# Altium project LED-Board_v2.1.PrjPcb
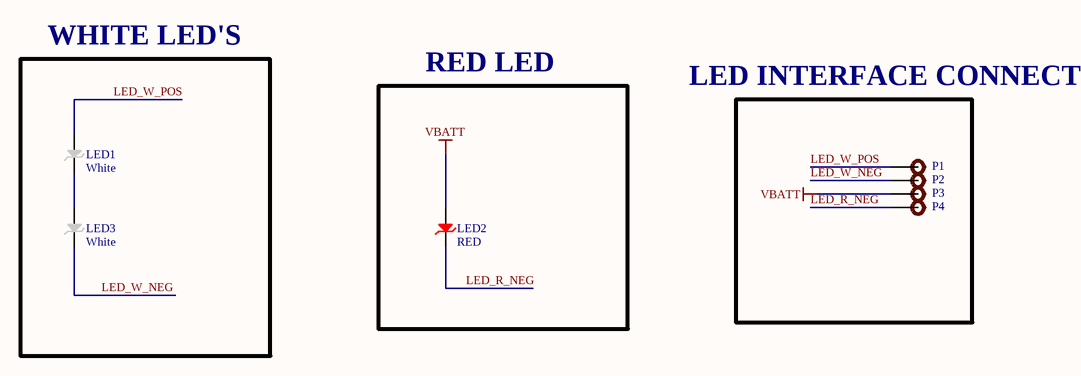
[diagram p0: LEDs_Sheet.SchDoc]
1 sheet, 7 parts. Net scope: global (net labels, ports and power ports of the same name join across sheets).
Board file: PCB_LED_Board_v2.1.PcbDoc

## Sheet LEDs_Sheet.SchDoc
size A; SheetNumber: 1; SheetTotal: 1

### Parts
LED1  White  [LED_SPHWH2L3D30CD4QTP3]
LED2  RED  [LED_SPHRD2L3DH20E7W41J]
LED3  White  [LED_SPHWH2L3D30CD4QTP3]
P1  TEST POINT  [Test-point]  (value not drawn)  (no BOM)
P2  TEST POINT  [Test-point]  (value not drawn)  (no BOM)
P3  TEST POINT  [Test-point]  (value not drawn)  (no BOM)
P4  TEST POINT  [Test-point]  (value not drawn)  (no BOM)

### Blocks framed on the sheet
WHITE LED'S: LED1 LED3
RED LED: LED2

### Nets
VBATT: LED2.1(A) P3.1
LED_R_NEG: LED2.2(K) P4.1
LED_W_NEG: LED3.2(K) P2.1
LED_W_POS: LED1.1(A) P1.1
NetLED1_2: LED1.2(K) LED3.1(A)

### Notes on the sheet
- LED INTERFACE CONNECTOR

### Library data of the parts
LED1 LED3 = SPHWH2L3D30CD4QTP3: LED Lighting LH351B White, Cool 5700K 2.8V 350mA 120° 1414 (3535 Metric); Manufacturer: Samsung Semiconductor, Inc.; Manufacturer Part Number: SPHWH2L3D30CD4QTP3; Digikey Part Number: 1510-2143-6-ND; Item Type: LED; Package: 0.138" L x 0.138" W (3.50mm x 3.50mm); ComponentLink1Description: Digikey Link; ComponentLink1URL: https://www.digikey.com/en/products/detail/samsung-semiconductor-inc/SPHWH2L3D30CD4QTP3/6569391
LED2 = SPHRD2L3DH20E7W41J: LED Lighting Color LH351H Red 660nm (650nm ~ 670nm); Manufacturer: Samsung Semiconductor, Inc.; Manufacturer Part Number: SPHRD2L3DH20E7W41J; Digikey Part Number: 1510-SPHRD2L3DH20E7W41JDKR-ND; Item Type: LED; Package: 0.138" L x 0.138" W (3.50mm x 3.50mm); ComponentLink1Description: Digikey Link; ComponentLink1URL: https://www.digikey.com/en/products/detail/samsung-semiconductor-inc/SPHRD2L3DH20E7W41J/13617167?s=N4IgTCBcDaIMoAUASAlAImAMgZjUsADAKIDsA6gCwCMAUiALoC%2BQA
P1-P4 = TEST POINT: Test Point ON; Item Type: TEST POINT